# Altium schematic sheet FlashMemory_Section.SchDoc
size A4; SheetNumber: 4; SheetTotal: 6
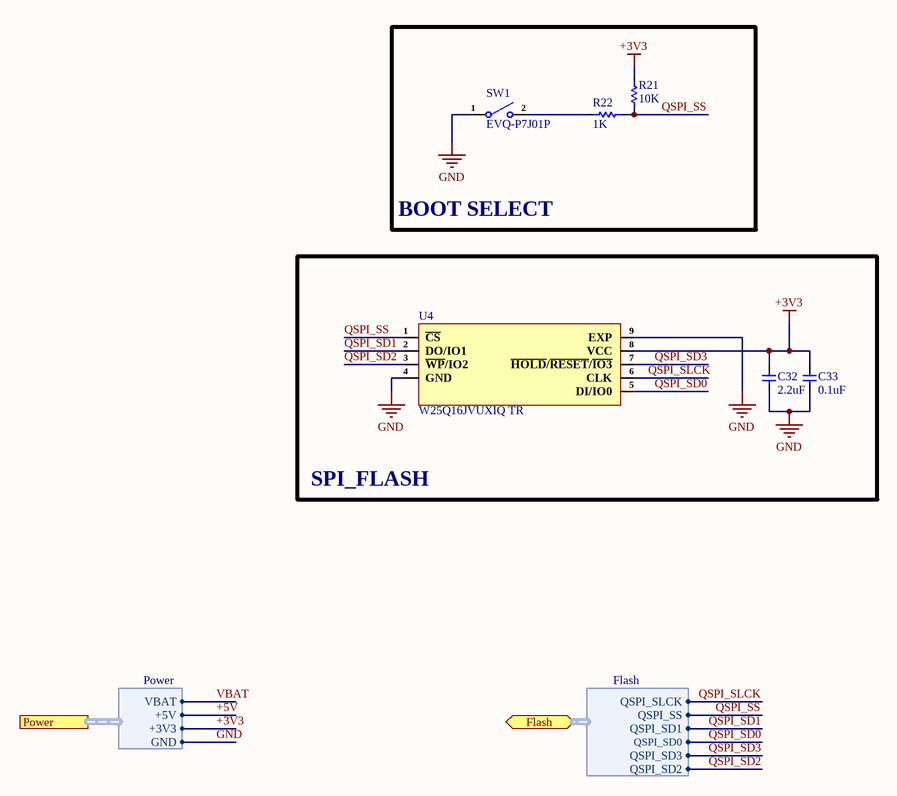
[diagram p0: FlashMemory_Section.SchDoc]

## Parts
C32  2.2uF  [CAP-0603]
C33  0.1uF  [Cap-0603]
R21  10K  [Res-0603]
R22  1K  [Res-0603]
SW1  EVQ-P7J01P  [EVQ-P7J01P]
U4  W25Q16JVUXIQ TR  [8-USON (2x3)]

## Blocks framed on the sheet
BOOT SELECT: R21 R22 SW1
SPI_FLASH: C32 C33 U4

## Ports
Flash (bidir, harness Flash, see Top-Sheet[3B], Controller_Section[3D]), Power (harness Power, see Top-Sheet[3B], Connector_Section[4D], Controller_Section[2D], Power_Section[3D], WiFiModule_Section[2D])

## Harnesses
Flash: QSPI_SLCK, QSPI_SS, QSPI_SD1, QSPI_SD3, QSPI_SD0, QSPI_SD2
Power: +5V, +3V3, GND, VBAT

## Nets
+3V3: C32.2 C33.2 R21.2 U4.8(VCC) ; port Power.+3V3
GND: C32.1 C33.1 SW1.1 U4.4(GND) U4.9(EXP) ; port Power.GND
+5V: port Power.+5V
QSPI_SD0: U4.5(DI/IO0) ; port Flash.QSPI_SD0
QSPI_SD1: U4.2(DO/IO1) ; port Flash.QSPI_SD1
QSPI_SD2: U4.3(~{WP}/IO2) ; port Flash.QSPI_SD2
QSPI_SD3: U4.7(~{HOLD}/~{RESET}/~{IO3}) ; port Flash.QSPI_SD3
QSPI_SLCK: U4.6(CLK) ; port Flash.QSPI_SLCK
QSPI_SS: R21.1 R22.2 U4.1(~{CS}) ; port Flash.QSPI_SS
VBAT: port Power.VBAT
NetR22_1: R22.1 SW1.2

## Notes on the sheet
- File:
- Title:
- Date:
- Page
- Num:
- Total:
- Drawn By: Huzaifa Ali

## Library data of the parts
C32 = CC0603KRX5R8BB225: CAP CER 2.2UF 25V X5R 0603; Manufacturer: Yageo; Tolerance: 10%; Item Type: Capacitor; Supplier 1: Digi-Key; Manufacturer Part Number: CC0603KRX5R8BB225; Stock 1: 687936; Pricing 1: 1=0.4, 10=0.276, 50=0.1932, 100=0.1656, 500=0.1242, 1000=0.10488 (USD); Mount: Surface Mount; Case/Package: 0603; Case Code (Metric): 1608; Case Code (Imperial): 0603; Weight: 7.1E-05oz; Min Operating Temperature: -55°C; Max Operating Temperature: 85°C; Packaging: Tape and Reel; Capacitance: 2.2uF; Dielectric: X5R; Voltage Rating: 25V; Termination: SMD/SMT; Resistor Type: Ceramic; Voltage Rating (DC): 25V; Package Quantity: 4000; Length: 1.6mm; Width: 0.031inch; Thickness: 0.037inch; Depth: 0.8mm; Radiation Hardening: No; Lead Free: Lead Free; Halogen Free: Halogen Free; RoHS Compliant: Yes; ComponentLink1URL: https://www.verical.com/server-webapp/html/getDatasheet?partID=782757&src-supplier=Verical; ComponentLink1Description: https://www.verical.com/server-webapp/html/getDatasheet?partID=782757&src-supplier=Verical; Supplier Part Number 1: 311-1786-1-ND; LCSC Part Number: C309478
C33 = CL10B104KB8NNNC: CAP CER 0.1UF 50V X7R 0603; Manufacturer: Samsung; Material: Ceramic; Capacitance: 100nF; Tolerance: 10%; Supplier 1: Digi-Key; Manufacturer Part Number: CL10B104KB8NNNC; RoHS: Yes; Category: Ceramic Capacitors; Stock 1: 3998791; Pricing 1: 1=0.10000, 10=0.03000, 50=0.01640, 100=0.01340, 500=0.00954, 1000=0.00750 (USD); Mount: Surface Mount; Case/Package: 0603; Case Code (Metric): 1608; Case Code (Imperial): 0603; Contact Plating: Tin; Min Operating Temperature: -55°C; Max Operating Temperature: 125°C; Dielectric: X7R; Voltage Rating: 50V; Package Quantity: 1; Packaging: Tape and Reel; Voltage: 50V; Voltage Rating (DC): 50V; Series: CL; Construction: Flat; Length: 1.6mm; Width: 0.031inch; Height: 0.8mm; Depth: 0.8mm; Thickness: 0.035inch; Radiation Hardening: No; Lead Free: Lead Free; RoHS Compliant: Yes; ComponentLink1URL: https://datasheet.ciiva.com/25803/cl10b104kb8nnnc-25803393.pdf?src-supplier=Digi-Key; ComponentLink1Description: https://datasheet.ciiva.com/25803/cl10b104kb8nnnc-25803393.pdf?src-supplier=Digi-Key; ComponentLink2URL: https://datasheet.ciiva.com/26838/getdatasheetpartid-89097-26838411.pdf?src-supplier=Verical; ComponentLink2Description: https://datasheet.ciiva.com/26838/getdatasheetpartid-89097-26838411.pdf?src-supplier=Verical; ComponentLink3URL: https://datasheet.ciiva.com/29198/456651-da-01-en-vs-kondensator-0605-29198839.pdf?src-supplier=Conrad; ComponentLink3Description: https://datasheet.ciiva.com/29198/456651-da-01-en-vs-kondensator-0605-29198839.pdf?src-supplier=Conrad; Supplier Part Number 1: 1276-1000-1-ND; LCSC Part Number: C1591
R21 = RT0603BRD0710KL: RES SMD 10K OHM 0.1% 1/10W 0603; Manufacturer: Yageo; Power: 100mW; Rated Temperature: 70°C; Value: 10kR; Temperature Coefficient: 25ppm/°C; Working Voltage: 75V; Package Height: 0.45mm; Package Length: 1.6mm; Package Width: 0.8mm; Item Type: Resistor; Supplier 1: Rs; Manufacturer Part Number: RT0603BRD0710KL; RoHS: Yes; Category: Chip SMD Resistors; Stock 1: 20510; Pricing 1: 100=0.29800, 250=0.27800, 500=0.25900, 1000=0.23700 (GBP); Mounting Technology: Surface Mount; Pins: 2; Case/Package: 0603; Min Operating Temperature: -55°C; Max Operating Temperature: 155°C; Tolerance: 0.1%; Resistor Type: FIXED RESISTOR; Construction: Chip; Package Style: SMTMeter; Packaging: Tape and Reel; Technology: THIN FILM; Termination: Wraparound; Reach SVHC Compliant: Yes; RoHS Compliant: Yes; ComponentLink1URL: https://datasheet.ciiva.com:443/pdfs/VipMasterIC/IC/YAGO/YAGO-S-A0008510989/YAGO-S-A0008510989-1.pdf?src-supplier=IHS+Markit; ComponentLink1Description: https://datasheet.ciiva.com:443/pdfs/VipMasterIC/IC/YAGO/YAGO-S-A0008510989/YAGO-S-A0008510989-1.pdf?src-supplier=IHS+Markit; ComponentLink2URL: https://datasheet.ciiva.com/5624/pyu-rt-1-to-0-05-rohs-l-4-5624351.pdf?src-supplier=Mouser; ComponentLink2Description: https://datasheet.ciiva.com/5624/pyu-rt-1-to-0-05-rohs-l-4-5624351.pdf?src-supplier=Mouser; ComponentLink3URL: https://datasheet.ciiva.com/29721/pyu-rt-1-to-0-05-rohs-l-4-29721177.pdf?src-supplier=Digi-Key; ComponentLink3Description: https://datasheet.ciiva.com/29721/pyu-rt-1-to-0-05-rohs-l-4-29721177.pdf?src-supplier=Digi-Key; Supplier Part Number 1: 1991391P; LCSC Part Number: C95204
R22 = RT0603DRD071KL: RES SMD 1K OHM 0.5% 1/10W 0603; Manufacturer: Yageo; Resistance: 1kR; Temperature Coefficient: 25ppm/°C; Power Rating: 100mW; Voltage Rating: 75V; Voltage Rating (DC): 50V; Supplier 1: Digi-Key; Manufacturer Part Number: RT0603DRD071KL; Stock 1: 178947; Pricing 1: 1=0.2, 10=0.167, 100=0.0651, 1000=0.02725, 2500=0.02498 (USD); Case/Package: 0603; Contact Plating: Tin,Matte; Case Code (Metric): 1608; Case Code (Imperial): 0603; Min Operating Temperature: -55°C; Max Operating Temperature: 125°C; Tolerance: 0.5%; Composition: Thin Film; Packaging: Tape and Reel; Termination: SMD/SMT; Radiation Hardening: No; Lead Free: Lead Free; ComponentLink1URL: http://www.mouser.com/ds/2/447/yageodocoutput-1125656.pdf?src-supplier=Mouser; ComponentLink1Description: http://www.mouser.com/ds/2/447/yageodocoutput-1125656.pdf?src-supplier=Mouser; ComponentLink2URL: http://www.yageo.com/documents/recent/PYu-RT_1-to-0.05_RoHS_L_6.pdf?src-supplier=Avnet; ComponentLink2Description: http://www.yageo.com/documents/recent/PYu-RT_1-to-0.05_RoHS_L_6.pdf?src-supplier=Avnet; Supplier Part Number 1: 311-1.0KDDKR-ND; LCSC Part Number: C165964
SW1 = EVQ-P7J01P: SWITCH TACTILE SPST-NO 0.05A 12V; Manufacturer: Panasonic; Mechanical Life: 100000Cycles; Actuator Color: Black; Operating Force: 1.6N; Current Rating: 50mA; Throw Configuration: SPST; Contact Resistance: 500mR; Illumination Type: Non-Illuminated; Switch Travel: 0.2mm; Switch Function: Off-Mom; Actuator Length: 0.65mm; Supplier: Mouser; Supplier Part Number: 667-EVQP7J01P; Manufacturer Part Number: EVQ-P7J01P; RoHS: Yes; Category: Tactile Switches; Stock: 9778; Pricing: 1=0.28, 10=0.252, 50=0.252, 100=0.217, 1000=0.173, 10000=0.148 (USD); Mounting Technology: Surface Mount; Case/Package: SMD/SMT; Min Operating Temperature: -20°C; Max Operating Temperature: 70°C; Package Quantity: 5000; Packaging: Tape and Reel; Voltage Rating (DC): 12V; Max Voltage Rating (DC): 12V; Termination: Gull Wing; Contact Current Rating: 50mA; Electrical Life: 100000Cycles; Orientation: Right Angle; Series: EVQP7; Length: 3.5mm; Width: 2.9mm; Height: 1.35mm; Radiation Hardening: No; Reach SVHC Compliant: No; Lead Free: Lead Free; RoHS Compliant: Yes; ComponentLink1URL: https://datasheet.ciiva.com/24076/atv0000ce4-259034-24076561.pdf?src-supplier=Mouser; ComponentLink1Description: https://datasheet.ciiva.com/24076/atv0000ce4-259034-24076561.pdf?src-supplier=Mouser; ComponentLink2URL: https://datasheet.ciiva.com/22777/atk0000ce20-22777575.pdf?src-supplier=Farnell; ComponentLink2Description: https://datasheet.ciiva.com/22777/atk0000ce20-22777575.pdf?src-supplier=Farnell; ComponentLink3URL: https://datasheet.ciiva.com/29974/atk0000ce20-29974069.pdf?src-supplier=Avnet; ComponentLink3Description: https://datasheet.ciiva.com/29974/atk0000ce20-29974069.pdf?src-supplier=Avnet; ComponentLink4URL: https://datasheet.ciiva.com/30252/atk0000ce20-30252044.pdf?src-supplier=Onlinecomponents.com; ComponentLink4Description: https://datasheet.ciiva.com/30252/atk0000ce20-30252044.pdf?src-supplier=Onlinecomponents.com; Item Type: SWITCH
U4 = W25Q16JVUXIQ TR: IC FLASH 16MBIT SPI/QUAD 8USON; Manufacturer: Winbond; Supplier: Digi-Key; Supplier Part Number: 256-W25Q16JVUXIQTRCT-ND; Manufacturer Part Number: W25Q16JVUXIQ TR; RoHS: No; Category: Memory; Stock: 47295; Pricing: 1=0.56, 10=0.51, 25=0.504, 50=0.501, 100=0.4479, 250=0.44416, 500=0.43758, 1000=0.42193 (USD)